# EasyEDA Pro project htx-studio-project_kpilekig-42ad306f.epro, schematic MotorLimit
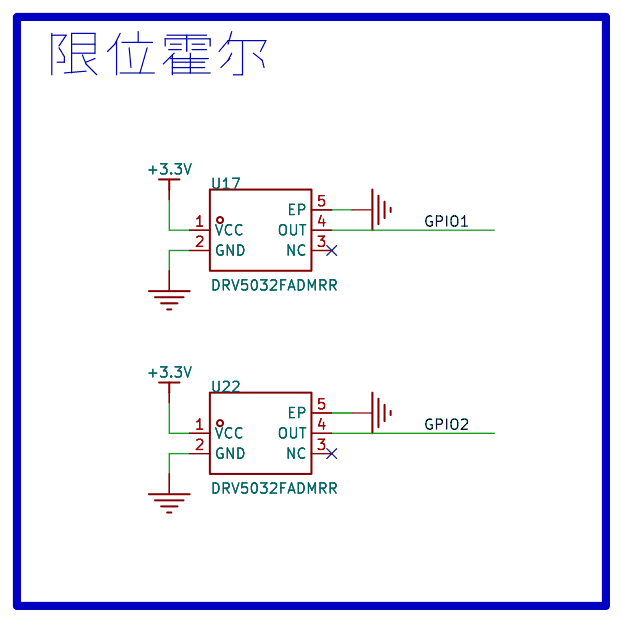
[diagram p3: schematic sheet]

## Parts
U17  DRV5032FADMRR  [XFDFN-4_L1.4-W1.1-P0.50-BL-EP]
U22  DRV5032FADMRR  [XFDFN-4_L1.4-W1.1-P0.50-BL-EP]

## Library data of the parts
U17 U22 = DRV5032FADMRR: DRV5032 低功耗（5Hz、&lt;1μA）、低电压（最高 5.5V）开关; LCSC Part Name: 数字锁存霍尔效应传感器; Supplier Part: C2152496; Manufacturer: TI(德州仪器); Supplier Footprint: SON-4-EP(1.1x1.4); JLCPCB Part Class: 扩展库; Datasheet: https://www.ti.com/cn/lit/gpn/drv5032; Supplier: LCSC; Type: 全极型; Voltage - Supply: 1.65V~5.5V; Operation Points: 3mT; Release Points: 1.5mT; Operating Temperature: -40℃~+85℃; Operating Current: 1.6uA; Sample Frequency: 20Hz; Output Type: 推挽

## Nets
+3.3V: U17.1(VCC) U22.1(VCC)
GND: U17.2(GND) U17.5(EP) U22.2(GND) U22.5(EP)
GPIO1: U17.4(OUT)
GPIO2: U22.4(OUT)

Not connected (* = marked no-connect by the designer): U17 3(NC)*; U22 3(NC)*

## Notes on the sheet
- 限位霍尔
